# EasyEDA Pro project Board2.epro

# Schematic Schematic3
Board Name: Board2; Create Date: 2026-03-19; Page Name: P1; Project Name: WF_ADC_DEMO; Schematic Name: Schematic3; Update Date: 2026-03-24; BladeWidth: 10; Company: 嘉立创EDA; Page Size: A4; RegionStart: 1; ShowBorder: 1; TitleBlock: 1; TitleBlockPosition: 3; Version: V1.0; XRegionCount: 6; YRegionCount: 4
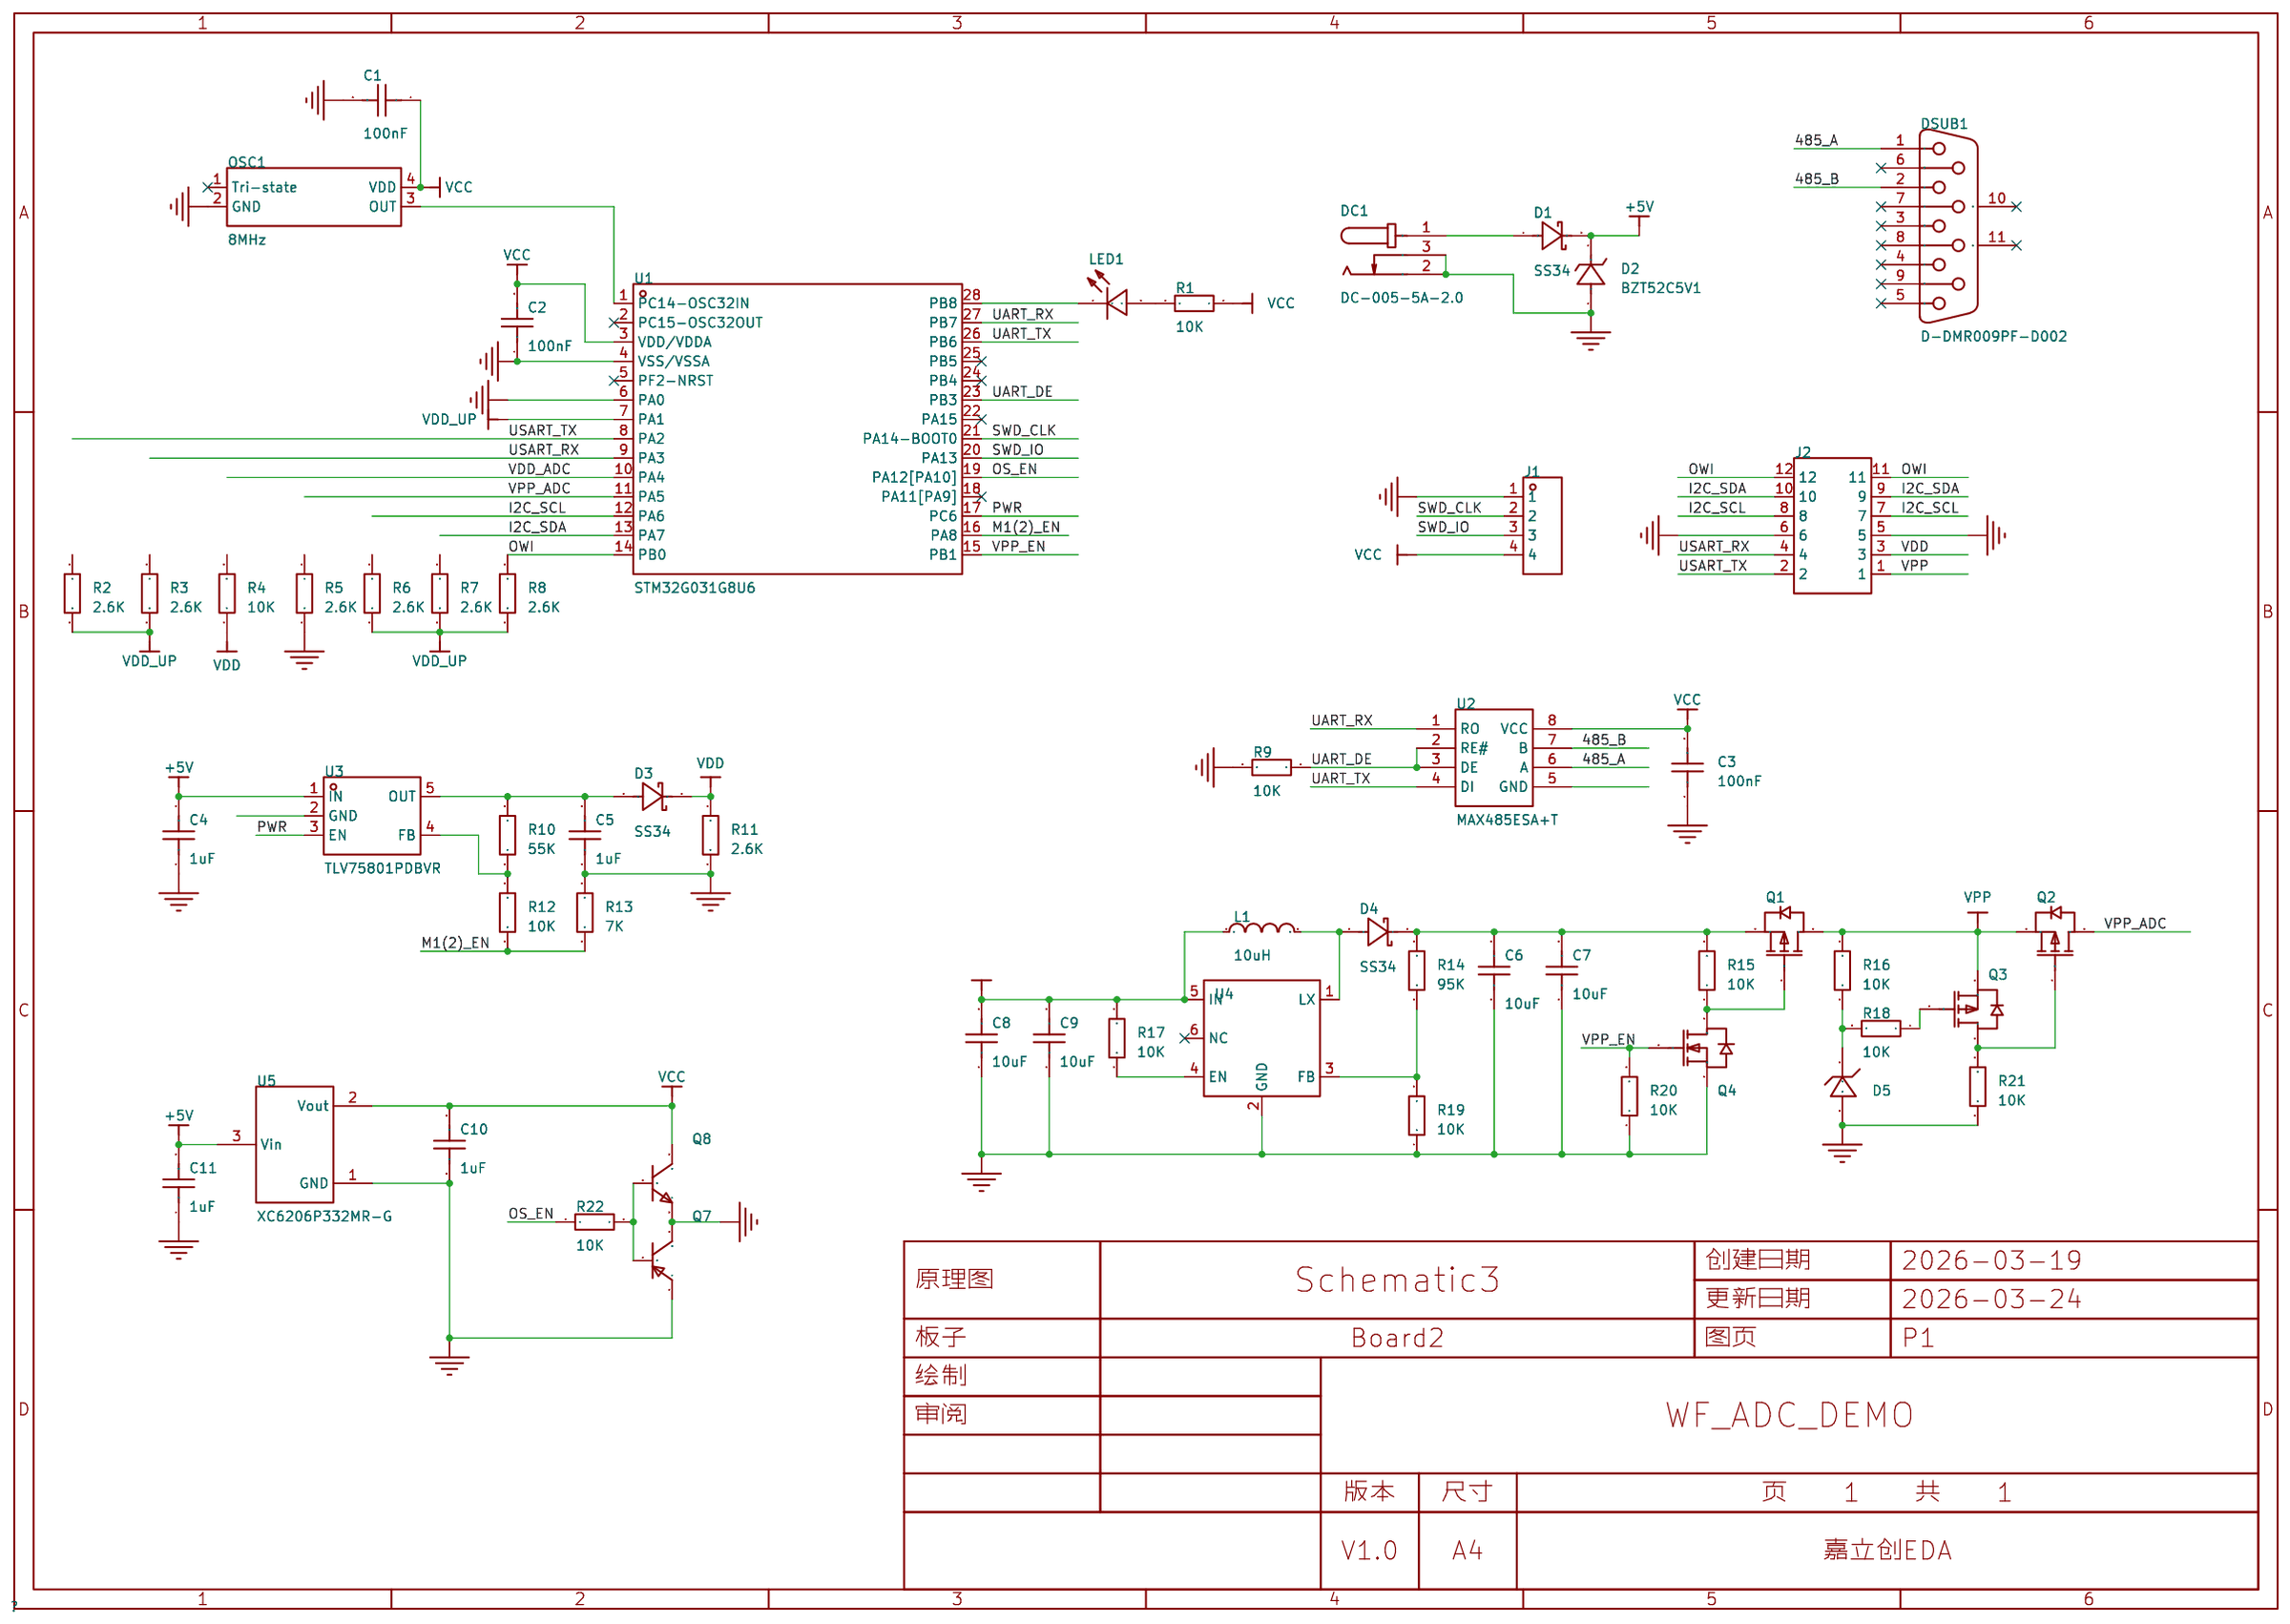
[diagram p0: schematic sheet]

## Parts
C1  100nF  [C0603]
C2  100nF  [C0603]
C3  100nF  [C0603]
C4  1uF  [C0603]
C5  1uF  [C0603]
C6  10uF  [C0805]
C7  10uF  [C0805]
C8  10uF  [C0805]
C9  10uF  [C0805]
C10  1uF  [C0603]
C11  1uF  [C0603]
D1  SS34  [SMA_L4.3-W2.6-LS5.0-FD]
D2  BZT52C5V1  [SOD-123_L2.7-W1.6-LS3.7-RD]
D3  SS34  [SMA_L4.3-W2.6-LS5.0-FD]
D4  SS34  [SMA_L4.3-W2.6-LS5.0-FD]
D5  SMBJ3.3A  [SMB_L4.6-W3.6-LS5.3-RD]
DC1  DC-005-5A-2.0  [DC-IN-TH_DC-005-5A-2.0]
DSUB1  D-DMR009PF-D002  [DSUB-TH_DMR-9S]
J1  PZ254V-11-04P  [HDR-TH_4P-P2.54-V-M]
J2  PZ254-2-06-W-8.5  [HDR-TH_12P-P2.54-H-M-R2-C6-S2.54-N]
L1  10uH  [IND-SMD_L5.4-W5.2_FXL0530]
LED1  NCD0603Y2  [LED0603-RD]
OSC1  8MHz  [OSC-SMD_4P-L3.2-W2.5-BL-1]
Q1  AO3401A  [SOT-23_L2.9-W1.3-P1.90-LS2.4-BR]
Q2  AO3401A  [SOT-23_L2.9-W1.3-P1.90-LS2.4-BR]
Q3  AO3401A  [SOT-23_L2.9-W1.3-P1.90-LS2.4-BR]
Q4  AO3400A  [SOT-23-3_L2.9-W1.3-P1.90-LS2.4-BR]
Q7  S8550  [SOT-23-3_L2.9-W1.3-P1.90-LS2.4-BR]
Q8  S8050  [SOT-23-3_L2.9-W1.3-P1.90-LS2.3-BR]
R1  10K  [R0603]
R2  2.6K  [R0603]
R3  2.6K  [R0603]
R4  10K  [R0603]
R5  2.6K  [R0603]
R6  2.6K  [R0603]
R7  2.6K  [R0603]
R8  2.6K  [R0603]
R9  10K  [R0603]
R10  55K  [R0603]
R11  2.6K  [R0603]
R12  10K  [R0603]
R13  7K  [R0603]
R14  95K  [R0603]
R15  10K  [R0603]
R16  10K  [R0603]
R17  10K  [R0603]
R18  10K  [R0603]
R19  10K  [R0603]
R20  10K  [R0603]
R21  10K  [R0603]
R22  10K  [R0603]
U1  STM32G031G8U6  [UFQFPN-28_L4.0-W4.0-P0.50-BL]
U2  MAX485ESA+T  [SOIC-8_L5.0-W4.0-P1.27-LS6.0-BL]
U3  TLV75801PDBVR  [SOT-23-5_L3.0-W1.7-P0.95-LS2.8-BR]
U4  SY7208ABC  [SOT-23-6_L2.9-W1.6-P0.95-LS2.8-BR]
U5  XC6206P332MR-G  [SOT-23-3_L2.9-W1.6-P1.90-LS2.8-BR]

## Library data of the parts
C1-C5 C10 C11 = CAP_0603: Supplier Footprint: 0603
C6-C9 = CAP_0805: Supplier Footprint: 0805
D1 D3 = SS34_C7420365: 二极管配置:独立式;正向压降(Vf):550mV@3.0A;直流反向耐压(Vr):40V;平均整流电流(Io):3A;; LCSC Part Name: 电压:40V 电流:3A; Supplier Part: C7420365; Manufacturer: 宏迦橙; Supplier Footprint: SMA(DO-214AC); JLCPCB Part Class: 扩展库; Datasheet: https://atta.szlcsc.com/upload/public/pdf/source/20230828/75438452AEE6C276EDA92B2AF599BE05.pdf; Supplier: LCSC; Diode Configuration: 独立式; Forward Voltage (Vf@If): 550mV@3.0A; Reverse Voltage (Vr): 40V; Average Rectified Current (Io): 3A; Reverse Leakage Current (Ir): 200uA@40V; Peak forward surge current: 80A
D2 = BZT52C5V1_C19077401: 二极管配置:独立式;稳压值(标称值):5.1V;稳压值(范围):4.85V~5.36V;功率(Pd):500mW;; Supplier Part: C19077401; Manufacturer: 宏迦橙; Supplier Footprint: SOD-123; JLCPCB Part Class: 扩展库; Datasheet: https://atta.szlcsc.com/upload/public/pdf/source/20241104/A31DF82E6D0CBEC29199D0B62829516E.pdf; Supplier: LCSC; Diode Configuration: 独立式; Zener Voltage (Nom): 5.1V; Reverse Leakage Current (Ir): 2uA@2V; Zener Voltage (Range): 4.85V~5.36V; Power Dissipation: 500mW; Zener Impedance (Zzt): 60Ω
D4 = SS34_C7420365: 二极管配置:独立式;正向压降(Vf):550mV@3.0A;直流反向耐压(Vr):40V;平均整流电流(Io):3A;; LCSC Part Name: 电压:40V 电流:3A; Supplier Part: C7420365; Manufacturer: 宏迦橙; Supplier Footprint: SMA(DO-214AC); JLCPCB Part Class: 扩展库; Datasheet: https://atta.szlcsc.com/upload/public/pdf/source/20230828/75438452AEE6C276EDA92B2AF599BE05.pdf; Supplier: LCSC; Diode Configuration: 独立式; Forward Voltage (Vf@If): 550mV@3.0A; Reverse Voltage (Vr): 40V; Average Rectified Current (Io): 3A; Reverse Leakage Current (Ir): 200uA@40V; Peak forward surge current: 80A; Voltage - Forward(Vf@If): 550mV@3.0A; Voltage - DC Reverse(Vr): 40V; Current - Rectified: 3A
D5 = SMBJ3.3A_C19077556: 极性:单向;反向截止电压(Vrwm):3.3V;钳位电压:8V;峰值脉冲电流(Ipp):75A@10/1000us;峰值脉冲功率(Ppp):600W@10/1000us;击穿电压:6.5V;; LCSC Part Name: 单向TVS 3.3V截止 峰值浪涌电流：75A@10/1000us; Supplier Part: C19077556; Manufacturer: R+O(宏嘉诚); Supplier Footprint: DO-214AA(SMB); JLCPCB Part Class: 扩展库; Datasheet: https://item.szlcsc.com/datasheet/SMBJ3.3A/20275641.html; Supplier: LCSC; Polarity: 单向; Reverse Stand-Off Voltage (Vrwm): 3.3V; Clamping Voltage: 8V; Peak Pulse Current (Ipp): 75A@10/1000us; Peak Pulse Power Dissipation (Ppp): 600W@10/1000us; Voltage - Breakdown: 6.5V; Reverse Leakage Current (Ir): 600uA; Operating Temperature: -55℃~+150℃; level of protection: IEC 61000-4-2; Type: TVS
DC1 = DC-005-5A-2.0: 连接器类型:DC电源插座;安装方式:弯插;触点内径:2mm;触点外径:6.2mm;额定电流:5A;额定电压:24V;工作温度范围:-20℃~+70℃;; LCSC Part Name: DC电源插座 内径:2mm 外径:6.2mm; Supplier Part: C381116; Manufacturer: XKB Connection(中国星坤); Supplier Footprint: 插件; JLCPCB Part Class: 扩展库; Datasheet: https://atta.szlcsc.com/upload/public/pdf/source/20211015/707A35F7AB6E89C57AAB641950105BB7.pdf; Supplier: LCSC; Connector Type: DC电源插座; Mounting Style: 弯插; Inside Contact Diameter: 2mm; Outside Contact Diameter: 6.2mm; Current Rating (Max): 5A; Voltage Rating (Max): 24V; Operating Temperature Range: -20℃~+70℃
DSUB1 = D-DMR009PF-D002: 连接器类型:常规D-Sub;公母:母;总PIN位数:9P;安装方式:弯插;排数:2;额定电流-信号脚:3A;工作温度范围:-50℃~+105℃;; LCSC Part Name: D-Sub 母 P数:9P; Supplier Part: C141882; Manufacturer: Ckmtw(灿科盟); Supplier Footprint: 弯插; JLCPCB Part Class: 扩展库; Datasheet: https://atta.szlcsc.com/upload/public/pdf/source/20171123/C141882_15114109686951137625.pdf; Supplier: LCSC; Connector Type: 常规D-Sub; Gender: 母; Number of Pins: 9P; Mounting Style: 弯插; Number of Rows: 2; Current Rating-Signal (Max): 3A; Colour: 黑色; Operating Temperature Range: -50℃~+105℃
J1 = PZ254V-11-04P: 插针结构:1x4P;间距:2.54mm;行距:-;圆针/方针:方针;安装类型:直插;排数:单排;总PIN位数:4P;额定电流:3A;额定电压:250V;配合针长度:6mm;塑高:2.5mm;端接针长度:3mm;触头材质:-;工作温度范围:-40℃~+105℃;颜色:黑色;; LCSC Part Name: 间距:2.54mm 1x4P 直插 方针; Supplier Part: C2691448; Manufacturer: XFCN(兴飞); Supplier Footprint: 插件,P=2.54mm; JLCPCB Part Class: 扩展库; Datasheet: https://atta.szlcsc.com/upload/public/pdf/source/20200309/C492403_F9F19131791D08044AD4F84F8E751A34.pdf; Supplier: LCSC; Pin Structure: 1x4P; Pitch: 2.54mm; Circluar Pins/Square Pins: 方针; Mounting Type: 直插; Number of Rows: 单排; Number of Pins: 4P; Current Rating (Max): 3A; Voltage Rating (Max): 250V; Length of Mating Pin: 6mm; Insulation Height: 2.5mm; Length of End Connection Pin: 3mm; Operating Temperature Range: -40℃~+105℃; Color: 黑色
J2 = PZ254-2-06-W-8.5: 插针结构:2x6P;间距:2.54mm;行距:2.54mm;圆针/方针:方针;安装方式:弯插;排数:双排;总PIN位数:12P;额定电流:3A;额定电压:-;配合针长度:6mm;塑高:2.5mm;端接针长度:-;触头材质:-;工作温度:-40℃~+105℃;颜色:黑色;; LCSC Part Name: 2x6P 间距:2.54mm 方针 弯插; Supplier Part: C2894986; Manufacturer: HCTL(华灿天禄); Supplier Footprint: 弯插,P=2.54mm; JLCPCB Part Class: 扩展库; Datasheet: https://item.szlcsc.com/datasheet/PZ254-2-06-W-8.5/3132662.html; Supplier: LCSC; Pin Structure: 2x6P; Pitch: 2.54mm; Row Spacing: 2.54mm; Circluar Pins/Square Pins: 方针; Mounting Type: 弯插; Number of Rows: 双排; Number of Pins: 12P; Current Rating: 3A; Length of Mating Pin: 6mm; Insulation Height: 2.5mm; Operating Temperature: -40℃~+105℃; Color: 黑色
L1 = FXL0530-100-M: 电感值:10uH;精度:±20%;额定电流:3.2A;饱和电流(Isat):3.5A;类型:一体成型电感;; LCSC Part Name: 10uH ±20% 3.5A; Supplier Part: C177248; Manufacturer: cjiang(长江微电); Supplier Footprint: SMD,5.4x5.2mm; JLCPCB Part Class: 扩展库; Datasheet: https://item.szlcsc.com/datasheet/FXL0530-100-M/188640.html; Supplier: LCSC; Tolerance: ±20%; Current Rating: 3.2A; Current - Saturation(Isat): 3.5A; DC Resistance(DCR): 125mΩ; Type: 一体成型电感
LED1 = NCD0603Y2: 灯头类型:-;发光颜色:黄色;正向压降(Vf):1.6V~2.6V;功率:65mW;正向电流:25mA;波长:586nm~595nm;二极管配置:独立二极管;透镜颜色:-;色温:-;发光强度:220mcd;发光角度:130°;载带方式:-;工作温度:-30℃~+85℃;; LCSC Part Name: 片式发光二极管; Supplier Part: C89811; Manufacturer: 国星光电; Supplier Footprint: 0603; JLCPCB Part Class: 扩展库; Datasheet: https://item.szlcsc.com/datasheet/NCD0603Y2/90993.html; Supplier: LCSC; Illumination Color: 黄色; Voltage - Forward(Vf): 1.6V~2.6V; Power(Watts): 65mW; Forward Current: 25mA; Wavelength - Dominant: 586nm~595nm; Peak Wavelength: 595nm; Diode Configuration: 独立二极管; Luminous Intensity: 220mcd; Viewing Angle: 130°; Operating Temperature: -30℃~+85℃
OSC1 = OT2EL4C4JI-111OLP-8M: 频率:8MHz;常温频差:±10ppm;输出模式:CMOS;工作电压:1.8V~3.3V;频率稳定度:±20ppm;; LCSC Part Name: 8MHZ?1.8V-3.3V?±10PPM YSO110TR; Supplier Part: C5189450; Manufacturer: YXC(扬兴晶振); Supplier Footprint: SMD3225-4P; JLCPCB Part Class: 扩展库; Datasheet: https://atta.szlcsc.com/upload/public/pdf/source/20240731/596E5F7673E50DA744B7F79F139FB8DF.pdf; Supplier: LCSC; Normal temperature Frequency Tolerance: ±10ppm; Output Type: CMOS; Voltage - Supply: 1.8V~3.3V; Frequency Stability: ±20ppm; Operating Temperature: -40℃~+85℃
Q1-Q3 = AO3401A_C15127: 数量:1个P沟道;漏源电压(Vdss):30V;连续漏极电流(Id):4A;导通电阻(RDS(on)):47mΩ@10V；85mΩ@2.5V；60mΩ@4.5V;耗散功率(Pd):-;阈值电压(Vgs(th)):900mV@250uA;; LCSC Part Name: 1个P沟道 耐压:30V 电流:4A; Supplier Part: C15127; Manufacturer: AOS; Supplier Footprint: SOT-23; JLCPCB Part Class: 基础库; Datasheet: https://item.szlcsc.com/datasheet/AO3401A/15801.html; Supplier: LCSC; Number: 1个P沟道; Drain to Source Voltage: 30V; Current - Continuous Drain(Id): 4A; RDS(on): 47mΩ@10V；85mΩ@2.5V；60mΩ@4.5V; Gate Threshold Voltage (Vgs(th)): 900mV@250uA; Gate Charge(Qg): 14nC@10V; Input Capacitance(Ciss): 645pF; Reverse Transfer Capacitance (Crss@Vds): 55pF; Output Capacitance(Coss): 80pF
Q4 = AO3400A_C20917: 数量:-;漏源电压(Vdss):30V;连续漏极电流(Id):-;导通电阻(RDS(on)):48mΩ@2.5V;耗散功率(Pd):-;阈值电压(Vgs(th)):1.45V@250uA;; LCSC Part Name: 1个N沟道 耐压:30V 电流:5.7A; Supplier Part: C20917; Manufacturer: AOS; Supplier Footprint: SOT-23-3L; JLCPCB Part Class: 基础库; Datasheet: https://item.szlcsc.com/datasheet/AO3400A/21629.html; Supplier: LCSC; Drain to Source Voltage: 30V; RDS(on): 48mΩ@2.5V; Gate Threshold Voltage (Vgs(th)): 1.45V@250uA; Gate Charge(Qg): 7nC@10V; Input Capacitance(Ciss): 630pF@15V; Operating Temperature: -55℃~+150℃@(Tj); Type: N沟道
Q7 = S8550_C20069126: 晶体管类型:PNP;集电极电流(Ic):500mA;集射极击穿电压(Vceo):25V;耗散功率(Pd):300mW;直流电流增益(hFE):120@500mA,1.0V;; LCSC Part Name: hFE:200-350，丝印:2TY PNP 电流:500mA 电压:25V; Supplier Part: C20069126; Manufacturer: R+O(宏嘉诚); Supplier Footprint: SOT-23; JLCPCB Part Class: 扩展库; Datasheet: https://item.szlcsc.com/datasheet/S8550/21397164.html; Supplier: LCSC; type: PNP; Current - Collector(Ic): 500mA; Collector - Emitter Voltage VCEO: 25V; Pd - Power Dissipation: 300mW; DC Current Gain: 120@500mA,1.0V; Transition frequency(fT): 150MHz; Current - Collector Cutoff: 100nA; Vce Saturation(VCE(sat)): 500mV; Operating Temperature: -55℃~+150℃; Emitter-Base Voltage(Vebo): 5V
Q8 = S8050_C20069125: 晶体管类型:NPN;集电极电流(Ic):500mA;集射极击穿电压(Vceo):25V;耗散功率(Pd):300mW;直流电流增益(hFE):120@50mA,1.0V;; LCSC Part Name: hFE:200-350，丝印:J3Y NPN 500mA 25V; Supplier Part: C20069125; Manufacturer: R+O(宏嘉诚); Supplier Footprint: SOT-23; JLCPCB Part Class: 扩展库; Datasheet: https://item.szlcsc.com/datasheet/S8050/21397163.html; Supplier: LCSC; type: NPN; Current - Collector(Ic): 500mA; Collector - Emitter Voltage VCEO: 25V; Pd - Power Dissipation: 300mW; DC Current Gain: 120@50mA,1.0V; Transition frequency(fT): 100MHz; Current - Collector Cutoff: 100nA; Vce Saturation(VCE(sat)): 600mV@500mA,50mA; Operating Temperature: -55℃~+150℃; Emitter-Base Voltage(Vebo): 5V
R1-R22 = Res_0603: Supplier Footprint: 0603
U1 = STM32G031G8U6: CPU内核:ARM-M系列;CPU最大主频:64MHz;应用领域:-;; LCSC Part Name: 主流Arm Cortex-M0+ MCU，具有64 KB Flash存储器、8 KB RAM、64 MHz CPU、2x USART、定时器、ADC和通信接口，1.7-3.6V; Supplier Part: C432211; Manufacturer: ST(意法半导体); Supplier Footprint: UFQFPN-28(4x4); JLCPCB Part Class: 扩展库; Datasheet: https://atta.szlcsc.com/upload/public/pdf/source/20190927/C432211_623EEFA1D407096BEEBF7364175DF17E.pdf; Supplier: LCSC; CPU Core: ARM-M系列; CPU Maximum Speed: 64MHz; Program Storage Size: 64KB; Program Memory Type: FLASH; Number of I/O: 26; ADC (Bit): 12bit; Low Voltage Detection Threshold: 1.7V~3.6V
U2 = MAX485ESA+T: 类型:收发器;数据速率:2.5Mbps;; LCSC Part Name: 低功耗，限斜率RS-485/RS-422收发器; Supplier Part: C19738; Manufacturer: ADI(亚德诺)/MAXIM(美信); Supplier Footprint: SOIC-8; JLCPCB Part Class: 扩展库; Datasheet: https://atta.szlcsc.com/upload/public/pdf/source/20140614/1457707090366.pdf; Supplier: LCSC; Types: 收发器; Number of Driver: 1; Number of receiver: 1; Supply Voltage: 4.75V~5.25V; Data Rate: 2.5Mbps; Operating Temperature: -40℃~+85℃
U3 = TLV75801PDBVR: 输出类型:可调;最大输入电压:6V;输出电压:550mV~5.5V;输出电流:500mA;输出极性:正极;; LCSC Part Name: 具有使能功能的 500mA、低 IQ、高精度、可调节超低压降稳压器; Supplier Part: C2877852; Manufacturer: TI(德州仪器); Supplier Footprint: SOT-23-5; JLCPCB Part Class: 扩展库; Datasheet: https://www.ti.com/cn/lit/gpn/tlv758p; Supplier: LCSC; Output Type: 可调; Maximum Input Voltage: 6V; Output Voltage: 550mV~5.5V; Output Current: 500mA; Dropout Voltage: 720mV@(500mA); standby current: 35uA; Feature: 防静电保护；软启动；短路保护；自动放电功能；低ESR；热保护(TSD)；欠压闭锁；过流保护(OCP)；带使能；防倒灌; Operating Temperature: -40℃~+125℃@(Tj); Output Polarity: 正极; Number of Outputs: 1
U4 = SY7208ABC: 功能类型:升压型;工作电压:3V~25V;输出电压:600mV~25V;输出电流:2A;输出类型:可调;; LCSC Part Name: 高效率1MHz 2A升压转换器; Supplier Part: C80514; Manufacturer: Silergy(矽力杰); Supplier Footprint: SOT-23-6; JLCPCB Part Class: 扩展库; Datasheet: https://item.szlcsc.com/datasheet/SY7208ABC/81660.html; Supplier: LCSC; Function: 升压型; Voltage - Supply: 3V~25V; Output Voltage: 600mV~25V; Output Current: 2A; Frequency - Switching: 800kHz~1.2MHz; Operating Temperature: -40℃~+125℃@(TJ); Synchronous Rectifier: 否; Number of Outputs: 1; Topology: 升压式; Quiescent Current: 100uA; Switch tube (built-in/external): 内置; Output Type: 可调
U5 = XC6206P332MR-G_C5446: 输出类型:固定;最大输入电压:6V;输出电压:3.3V;最大输出电流:200mA;电源纹波抑制比(PSRR):-;输出极性:正极;; LCSC Part Name: 输入6V 输出3.3V 200mA; Supplier Part: C5446; Manufacturer: TOREX(特瑞仕); Supplier Footprint: SOT-23-3L; JLCPCB Part Class: 基础库; Datasheet: https://atta.szlcsc.com/upload/public/pdf/source/20130823/1457706639850.pdf; Supplier: LCSC; Output Type: 固定; Maximum Input Voltage: 6V; Output Voltage: 3.3V; MAX Output Current: 200mA; Dropout Voltage: 680mV@(100mA); Output Polarity: 正极; Number of Outputs: 1

## Nets
+5V: C4.2 C8.2 C9.2 C11.2 D1.2(K) D2.1(K) L1.1 R17.2 U3.1(IN) U4.5(IN) U5.3(Vin)
GND: C1.2 C2.1 C3.1 C4.1 C5.1 C6.1 C7.1 C8.1 C9.1 C10.1 C11.1 D2.2(A) D5.2 DC1.2 DC1.3 J1.1 OSC1.2(GND) Q4.2(S) Q7.2(E) R5.2 R9.2 R11.2 R13.2 R19.1 R20.1 R21.1 U1.4(VSS/VSSA) U2.5(GND) U3.2(GND) U4.2(GND) U5.1(GND)
PGND: J2.5 J2.6 Q7.3(C) Q8.2(E) U1.6(PA0)
VCC: C1.1 C2.2 C3.2 C10.2 J1.4 OSC1.4(VDD) Q8.3(C) R1.1 U1.3(VDD/VDDA) U2.8(VCC) U5.2(Vout)
VDD: D3.2(K) J2.3 R4.1 R11.1
VDD_ADC: R4.2 U1.10(PA4)
VDD_UP: R2.2 R3.2 R6.2 R7.2 R8.2 U1.7(PA1)
485_A: DSUB1.1 U2.6(A)
485_B: DSUB1.2 U2.7(B)
I2C_SCL: J2.7 J2.8 R6.1 U1.12(PA6)
I2C_SDA: J2.9 J2.10 R7.1 U1.13(PA7)
M1(2)_EN: R12.1 R13.1 U1.16(PA8)
OS_EN: R22.1 U1.19(PA12[PA10])
OWI: J2.11 J2.12 R8.1 U1.14(PB0)
PWR: U1.17(PC6) U3.3(EN)
SWD_CLK: J1.2 U1.21(PA14-BOOT0)
SWD_IO: J1.3 U1.20(PA13)
UART_DE: R9.1 U1.23(PB3) U2.2(RE#) U2.3(DE)
UART_RX: U1.27(PB7) U2.1(RO)
UART_TX: U1.26(PB6) U2.4(DI)
USART_RX: J2.4 R3.1 U1.9(PA3)
USART_TX: J2.2 R2.1 U1.8(PA2)
VPP: J2.1 Q1.3(D) Q2.2(S) Q3.2(S) R16.2
VPP_ADC: Q2.3(D) R5.1 U1.11(PA5)
VPP_EN: Q4.1(G) R20.2 U1.15(PB1)
$1N1691: R10.1 R12.2 U3.4(FB)
$1N1692: C5.2 D3.1(A) R10.2 U3.5(OUT)
$1N3646: R17.1 U4.4(EN)
$1N3648: R14.1 R19.2 U4.3(FB)
$1N3649: D4.1(A) L1.2 U4.1(LX)
$1N3650: C6.2 C7.2 D4.2(K) Q1.2(S) R14.2 R15.2
$1N6475: Q7.1(B) Q8.1(B) R22.2
$1N6524: Q1.1(G) Q4.3(D) R15.1
$1N8025: D1.1(A) DC1.1
$1N8260: OSC1.3(OUT) U1.1(PC14-OSC32IN)
$1N9279: Q2.1(G) Q3.3(D) R21.2
$1N9281: D5.1 R16.1 R18.2
$1N9282: Q3.1(G) R18.1
$1N12699: LED1.1(K) U1.28(PB8)
$1N12700: LED1.2(A) R1.2

Not connected (* = marked no-connect by the designer): DSUB1 3* 4* 5* 6* 7* 8* 9* 10(MH1)* 11(MH2)*; OSC1 1(Tri-state)*; U1 2(PC15-OSC32OUT)* 5(PF2-NRST)* 18(PA11[PA9])* 22(PA15)* 24(PB4)* 25(PB5)*; U4 6(NC)*

# Board 16005 WF280_OS_V1_20260323
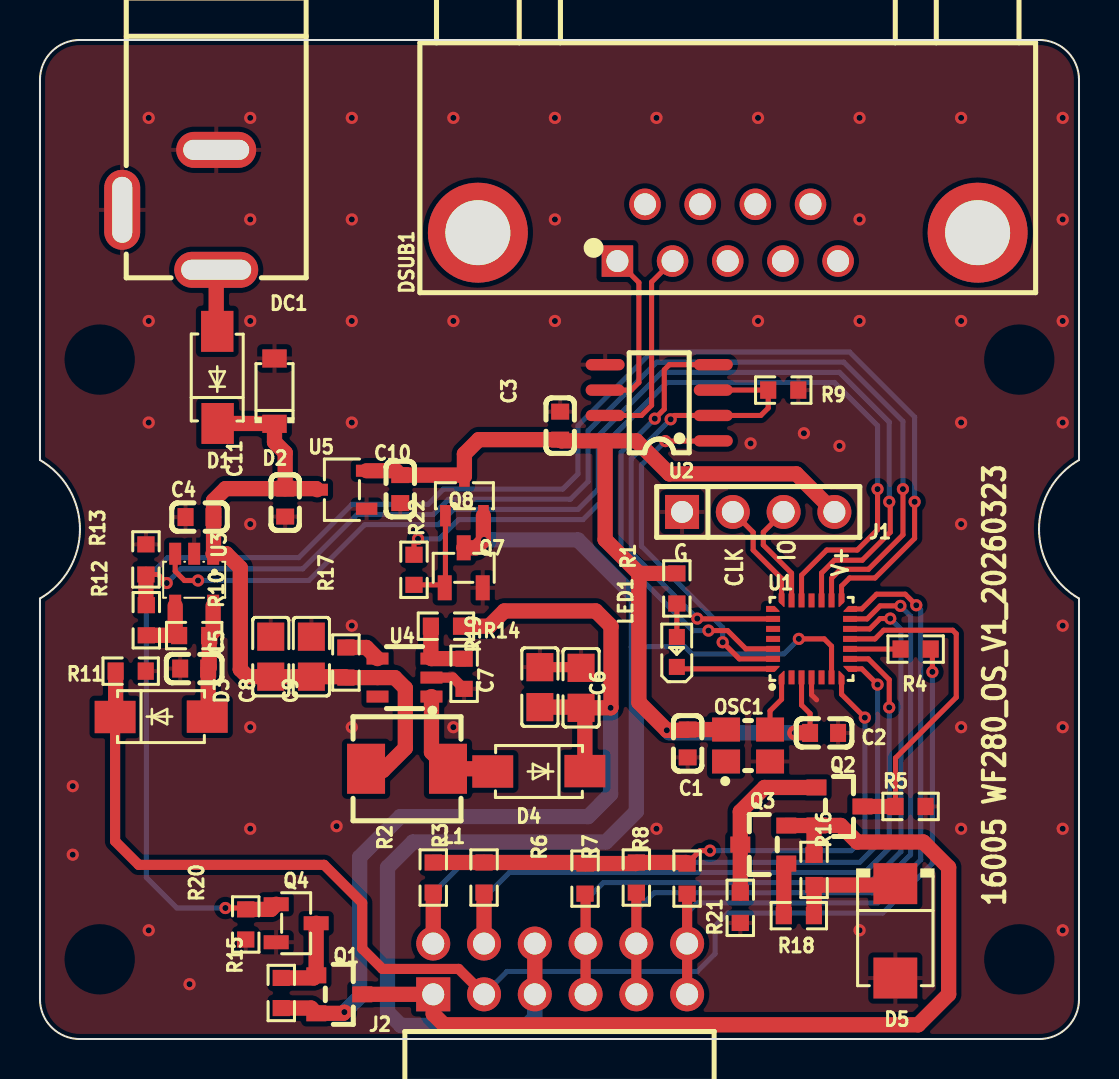
[diagram p1: board, top side]
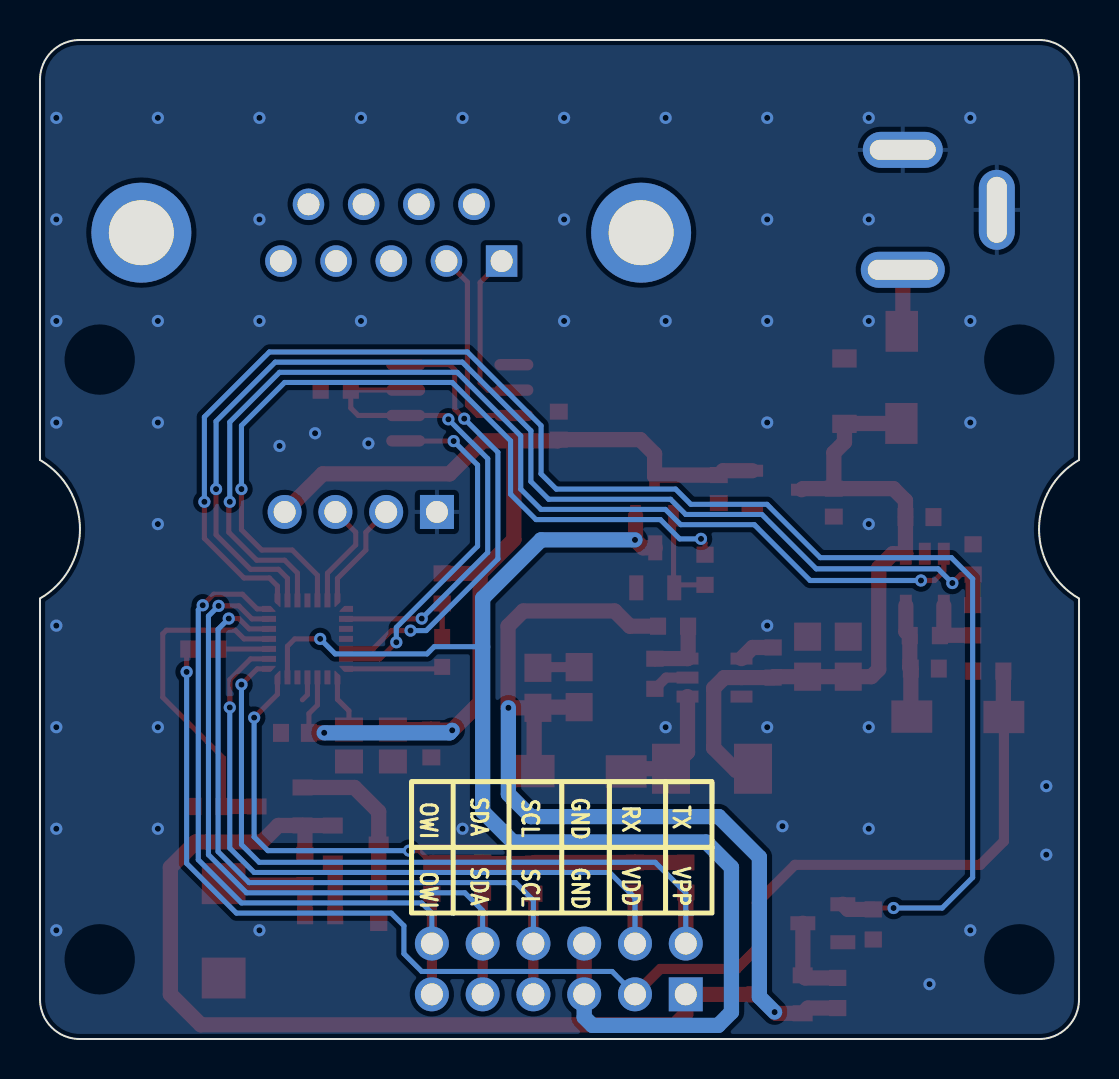
[diagram p2: board, bottom side, seen from below]

Outline 51.98 x 49.98 mm; copper layers: Top Layer, Bottom Layer. Coordinates in mm from the lower left corner of the outline.
Outline path: 0,47.99 arc(0.58,49.39) 1.99,49.98 49.99,49.98 arc(51.39,49.39) 51.98,47.99 51.98,28.96 arc(49.98,25.5) 51.98,22.04 51.98,1.99 arc(51.39,0.58) 49.99,0 1.99,0 arc(0.58,0.58) 0,1.99 0,22.04 arc(2,25.5) 0,28.96 0,47.99
Stack: Top Layer 0.035mm / Dielectric1 1.51mm FR4 er 4.5 / Bottom Layer 0.035mm

## Design rules (mm)
spacing copperThickness1oz (default): track to track 0.102, other pairs 0.152 to 0.3
spacing copperThickness2oz: track to track 0.203, other pairs 0.152 to 0.3
spacing Plane_innerPlane: track to track 0.102, other pairs 0.152 to 0.3
spacing Copper_copperRegion: track to track 0.102, other pairs 0.152 to 0.3
track width copperThickness1oz (default): min 0.127, default 0.254, max 2.54
track width copperThickness2oz: min 0.203, default 0.254, max 2.54
differential pair differentialPair (default): width min 0.127, default 0.254, max 2.54; gap min 0.152, default 0.152
pour e1324 uses Copper_copperRegion
pour e1338 uses Copper_copperRegion

## Placement (name value [footprint] x y rotation side)
C1  100nF  [C0603]  32.4 14.79 270 top
C2  100nF  [C0603]  39.22 15.31 180 top
C3  100nF  [C0603]  26.02 30.68 270 top
C4  1uF  [C0603]  7.98 26.11 0 top
C5  1uF  [C0603]  7.71 18.53 0 top
C6  10uF  [C0805]  27.07 17.57 270 top
C7  10uF  [C0805]  25.01 17.6 270 top
C8  10uF  [C0805]  11.54 19.13 270 top
C9  10uF  [C0805]  13.58 19.13 270 top
C10  1uF  [C0603]  18.02 27.51 90 top
C11  1uF  [C0603]  12.27 26.83 90 top
D1  SS34  [SMA_L4.3-W2.6-LS5.0-FD]  8.88 33.1 270 top
D2  BZT52C5V1  [SOD-123_L2.7-W1.6-LS3.7-RD]  11.73 32.41 90 top
D3  SS34  [SMA_L4.3-W2.6-LS5.0-FD]  6.06 16.12 180 top
D4  SS34  [SMA_L4.3-W2.6-LS5.0-FD]  24.95 13.39 0 top
D5  SMBJ3.3A  [SMB_L4.6-W3.6-LS5.3-RD]  42.79 5.41 270 top
DC1  DC-005-5A-2.0  [DC-IN-TH_DC-005-5A-2.0]  6.46 41.48 270 top
DSUB1  D-DMR009PF-D002  [DSUB-TH_DMR-9S]  34.4 40.34 90 top
J1  PZ254V-11-04P  [HDR-TH_4P-P2.54-V-M]  35.93 26.37 0 top
J2  PZ254-2-06-W-8.5  [HDR-TH_12P-P2.54-H-M-R2-C6-S2.54-N]  26.02 3.51 0 top
L1  10uH  [IND-SMD_L5.4-W5.2_FXL0530]  18.36 13.52 0 top
LED1  NCD0603Y2  [LED0603-RD]  31.86 19.36 90 top
OSC1  8MHz  [OSC-SMD_4P-L3.2-W2.5-BL-1]  35.42 14.68 0 top
Q1  AO3401A  [SOT-23_L2.9-W1.3-P1.90-LS2.4-BR]  14.97 2.24 180 top
Q2  AO3401A  [SOT-23_L2.9-W1.3-P1.90-LS2.4-BR]  39.99 11.63 180 top
Q3  AO3401A  [SOT-23_L2.9-W1.3-P1.90-LS2.4-BR]  36.18 9.73 0 top
Q4  AO3400A  [SOT-23-3_L2.9-W1.3-P1.90-LS2.4-BR]  12.81 5.79 180 top
Q7  S8550  [SOT-23-3_L2.9-W1.3-P1.90-LS2.4-BR]  21.2 23.57 270 top
Q8  S8050  [SOT-23-3_L2.9-W1.3-P1.90-LS2.3-BR]  21.23 27.17 270 top
R1  10K  [R0603]  31.86 22.54 270 top
R2  2.6K  [R0603]  19.67 8.08 90 top
R3  2.6K  [R0603]  22.21 8.08 90 top
R4  10K  [R0603]  43.8 19.51 180 top
R5  2.6K  [R0603]  43.55 11.63 0 top
R6  2.6K  [R0603]  27.26 8.02 90 top
R7  2.6K  [R0603]  29.83 8.08 90 top
R8  2.6K  [R0603]  32.37 8.02 90 top
R9  10K  [R0603]  37.18 32.46 0 top
R10  55K  [R0603]  7.71 20.18 0 top
R11  2.6K  [R0603]  4.54 18.4 0 top
R12  10K  [R0603]  5.32 20.95 270 top
R13  7K  [R0603]  5.3 23.99 90 top
R14  95K  [R0603]  20.31 20.65 0 top
R15  10K  [R0603]  12.07 2.3 270 top
R16  10K  [R0603]  38.72 8.46 90 top
R17  10K  [R0603]  15.3 18.83 270 top
R18  10K  [R0603]  37.96 6.17 0 top
R19  10K  [R0603]  21.22 18.27 90 top
R20  10K  [R0603]  10.29 5.73 90 top
R21  10K  [R0603]  35.03 6.56 90 top
R22  10K  [R0603]  18.71 23.47 270 top
U1  STM32G031G8U6  [UFQFPN-28_L4.0-W4.0-P0.50-BL]  38.6 20.02 0 top
U2  MAX485ESA+T  [SOIC-8_L5.0-W4.0-P1.27-LS6.0-BL]  30.98 31.83 90 top
U3  TLV75801PDBVR  [SOT-23-5_L3.0-W1.7-P0.95-LS2.8-BR]  7.71 22.98 90 top
U4  SY7208ABC  [SOT-23-6_L2.9-W1.6-P0.95-LS2.8-BR]  18.23 18.08 0 top
U5  XC6206P332MR-G  [SOT-23-3_L2.9-W1.6-P1.90-LS2.8-BR]  15.11 27.48 0 top

## Footprints (pads in the part's own frame, mm; a bottom-side part is the same pattern mirrored in y, then rotated)
C0603
  rect 0.8x0.9 smd: 1(-0.7,0) 2(0.7,0)
C0805
  rect 1.41x1.35 smd: 1(-1,0) 2(1,0)
DC-IN-TH_DC-005-5A-2.0
  oval 1.8x4.2 hole 1x3.5: 1(3,2.352)
  oval 1.8x4 hole 1x3.3: 2(-3,2.352)
  oval 4x1.8 hole 3.3x1: 3(-0.001,-2.352)
DSUB-TH_DMR-9S
  rect 1.575x1.575 hole 1.1: 1(-1.42,5.52)
  round 1.575 hole 1.1: 2(-1.42,2.76) 3(-1.42,0) 4(-1.42,-2.76) 5(-1.42,-5.52) 6(1.42,4.14) 7(1.42,1.38) 8(1.42,-1.38) 9(1.42,-4.14)
  round 5 hole 3.25: 10(0,12.5) 11(0,-12.5)
HDR-TH_4P-P2.54-V-M
  rect 1.7x1.7 hole 1.1: 1(-3.81,0)
  round 1.7 hole 1.1: 2(-1.27,0) 3(1.27,0) 4(3.81,0)
HDR-TH_12P-P2.54-H-M-R2-C6-S2.54-N
  rect 1.7x1.7 hole 1.1: 1(-6.35,-1.27)
  round 1.7 hole 1.1: 2(-6.35,1.27) 3(-3.81,-1.27) 4(-3.81,1.27) 5(-1.27,-1.27) 6(-1.27,1.27) 7(1.27,-1.27) 8(1.27,1.27) 9(3.81,-1.27) 10(3.81,1.27) 11(6.35,-1.27) 12(6.35,1.27)
IND-SMD_L5.4-W5.2_FXL0530
  rect 1.9x2.5 smd: 1(-2.05,0) 2(2.05,0)
LED0603-RD
  rect 0.8x0.8 smd: 1(-0.749,0) 2(0.749,0)
OSC-SMD_4P-L3.2-W2.5-BL-1
  rect 1.4x1.2 smd: 1(-1.1,-0.8) 2(1.1,-0.8) 3(1.1,0.8) 4(-1.1,0.8)
R0603
  rect 0.806x0.864 smd: 1(-0.753,0) 2(0.753,0)
SMA_L4.3-W2.6-LS5.0-FD
  rect 2.046x1.62 smd: 1(-2.304,-0.009) 2(2.304,0.009)
SMB_L4.6-W3.6-LS5.3-RD
  rect 2.047x2.192 smd: 1(-2.361,0) 2(2.361,0)
SOD-123_L2.7-W1.6-LS3.7-RD
  rect 0.91x1.22 smd: 1(-1.635,0) 2(1.635,0)
SOIC-8_L5.0-W4.0-P1.27-LS6.0-BL
  oval 0.569x1.95 smd: 1(-1.905,-2.705) 2(-0.635,-2.705) 3(0.635,-2.705) 4(1.905,-2.705) 5(1.905,2.705) 6(0.635,2.705) 7(-0.635,2.705) 8(-1.905,2.705)
SOT-23-3_L2.9-W1.3-P1.90-LS2.3-BR
  rect 1.07x0.532 smd: 1(0.99,-0.95) 2(0.99,0.95) 3(-0.99,0)
SOT-23-3_L2.9-W1.3-P1.90-LS2.4-BR
  rect 1.25x0.7 smd: 1(1,-0.95) 2(1,0.95) 3(-1,0)
SOT-23-3_L2.9-W1.6-P1.90-LS2.8-BR
  rect 1.07x0.6 smd: 1(1.235,-0.95) 2(1.235,0.95) 3(-1.235,0)
SOT-23-5_L3.0-W1.7-P0.95-LS2.8-BR
  rect 1.1x0.6 smd: 1(1.3,-0.95) 2(1.3,0) 3(1.3,0.95) 4(-1.3,0.95) 5(-1.3,-0.95)
SOT-23-6_L2.9-W1.6-P0.95-LS2.8-BR
  rect 1.1x0.6 smd: 1(1.35,-0.95) 2(1.35,0) 3(1.35,0.95) 4(-1.35,0.95) 5(-1.35,0) 6(-1.35,-0.95)
SOT-23_L2.9-W1.3-P1.90-LS2.4-BR
  rect 1x0.8 smd: 1(1.15,-0.95) 2(1.15,0.95) 3(-1.15,0)
UFQFPN-28_L4.0-W4.0-P0.50-BL
  custom 0.3x0.675 smd: 1(-1.5,-1.875) 7(1.5,-1.875) 15(1.5,1.875) 21(-1.5,1.875)
  rect 0.3x0.7 smd: 2(-1,-1.925) 3(-0.5,-1.925) 4(0,-1.925) 5(0.5,-1.925) 6(1,-1.925) 16(1,1.925) 17(0.5,1.925) 18(0,1.925) 19(-0.5,1.925) 20(-1,1.925)
  custom 0.675x0.3 smd: 8(1.875,-1.5) 14(1.875,1.5) 22(-1.875,1.5) 28(-1.875,-1.5)
  rect 0.7x0.3 smd: 9(1.925,-1) 10(1.925,-0.5) 11(1.925,0) 12(1.925,0.5) 13(1.925,1) 24(-1.925,0.5) 25(-1.925,0) 26(-1.925,-0.5) 27(-1.925,-1)
  custom 0.7x0.3 smd: 23(-1.925,1)

## Nets
As in the schematic.

Pads without a net: DSUB1 3 4 5 6 7 8 9 10 11; OSC1 1; U1 2 5 18 22 24 25; U4 6

## Via types
v1: diameter 0.61, hole 0.305, Top Layer to Bottom Layer, 79 vias

## Routing (per net, layer and track width the routed paths; a pad name or vN(x,y) marks a point on that pad's centre or on a via; arc(x,y) is an arc through that point)
+5V: length 35.2
  Top Layer w0.762: U5.3 13.81,27.53 C11.2 ; C11.2 9.28,27.53 8.68,26.93 C4.2 8.68,24.29 U3.1 9.32,24.28 10.02,23.57 10.02,18.49 10.39,18.13 C8.2 C9.2 15.26,18.13 R17.2 U4.5 17.75,18.08 18.28,17.55 18.28,14.55 17.16,13.44 16.39,13.44 ; C11.2 12.27,29.33 11.73,29.86 11.73,30.77 11.71,30.79 D1.2
GND: length 5.2
  Top Layer w0.254: 38.85,16.97 38.6,17.22 U1.4
  Top Layer w0.508: C6.1 27.03,18.6 C7.1 ; U4.2 20.65,18.08 21.22,17.52
  vias: v1(1.64,12.65) v1(1.64,9.22) v1(5.44,46.08) v1(5.44,35.92) v1(5.44,30.84) v1(5.44,5.44) v1(7.48,2.74) v1(10.52,46.08) v1(10.52,41) v1(10.52,35.92) v1(10.52,25.76) v1(10.52,15.6) v1(10.52,10.52) v1(14.84,10.65) v1(15.6,46.08) v1(15.6,41) v1(15.6,35.92) v1(15.6,30.84) v1(15.6,20.68) v1(15.6,15.6) v1(20.68,46.08) v1(20.68,35.92) v1(20.68,15.6) v1(25.76,46.08) v1(25.76,41) v1(25.76,35.92) v1(30.84,46.08) v1(30.84,10.52) v1(35.55,29.79) v1(35.92,46.08) v1(35.92,35.92) v1(38.21,30.3) v1(39.99,29.67) v1(41,46.08) v1(41,41) v1(41,35.92) v1(41,5.44) v1(46.08,46.08) v1(46.08,35.92) v1(46.08,30.84) v1(46.08,25.76) v1(46.08,15.6) v1(46.08,10.52) v1(51.16,46.08) v1(51.16,41) v1(51.16,35.92) v1(51.16,30.84) v1(51.16,20.68) v1(51.16,15.6) v1(51.16,10.52) v1(51.16,5.44)
PGND: length 66.1
  Top Layer w0.254: v1(37.96,20.02) 39.23,20.02 39.6,19.65 U1.6
  Top Layer w0.762: J2.6 J2.5 ; Q8.2 22.18,24.94 21.82,24.57 Q7.3
  Bottom Layer w0.254: 29.83,19.63 32.25,19.63 32.62,19.26 37.21,19.26 v1(37.96,20.02)
  Bottom Layer w0.762: J2.5 24.75,1.09 24.34,0.68 18.05,0.68 17.39,1.35 17.39,8.59 18.66,9.86 28.31,9.86 29.83,11.38 29.83,22.05 26.91,24.97 v1(22.21,24.97)
VCC: length 57.2
  Top Layer w0.254: C2.2 38.52,16.28 38.1,16.71 U1.3
  Top Layer w0.762: U2.8 29.83,29.92 31.48,28.27 37.83,28.27 J1.4 ; U2.8 28.27,24.98 29.96,23.29 ; U2.8 26.08,29.92 C3.2 21.95,29.98 21.23,29.27 Q8.3 21.18,28.21 C10.2 17.8,28.43 U5.2 ; OSC1.4 32.4,15.48 C1.1 32.36,15.44 v1(31.36,15.44) 29.96,16.84 29.96,23.29 ; v1(37.76,15.32) 38.52,15.32 C2.2 ; 29.96,23.29 R1.1
  Bottom Layer w0.762: v1(31.36,15.44) 31.48,15.32 v1(37.76,15.32)
VDD: length 68.2
  Top Layer w0.254: v1(44.64,18.36) 44.64,19.42 R4.1
  Top Layer w0.508: D3.2 3.76,9.89 4.94,8.71 14.21,8.71 16.12,6.81 16.12,4.52 17.13,3.51 20.94,3.51 J2.3
  Top Layer w0.762: R11.1 3.78,16.13 D3.2
  Bottom Layer w0.254: v1(44.64,18.36) 44.64,8.79 42.15,6.3 34.4,6.3 33.77,5.66 33.77,4.27 32.88,3.38 23.36,3.38 J2.3
VDD_ADC: length 2.5
  Top Layer w0.254: 40.52,19.52 40.53,19.51 R4.2
VDD_UP: length 30.7
  Top Layer w0.254: R8.2 33.02,9.42 v1(33.52,9.42) ; 40.1,18.08 40.1,17.25 v1(41.26,16.08)
  Top Layer w0.762: R2.2 R3.2 27.21,8.83 R6.2 29.78,8.78 R7.2 32.32,8.83 R8.2
  Bottom Layer w0.254: v1(33.52,9.42) 40.58,9.42 41.26,10.11 v1(41.26,16.08)
485_A: length 8.4
  Top Layer w0.254: DSUB1.1 29.96,37.84 29.96,32.84 29.58,32.46 U2.6
485_B: length 10.2
  Top Layer w0.254: DSUB1.2 30.59,37.87 30.59,31.7 30.09,31.19 U2.7
I2C_SCL: length 38.1
  Top Layer w0.254: 40.52,20.52 41.51,20.52 42.03,21.03 v1(42.53,21.03)
  Top Layer w0.508: R6.1 27.29,7.24 J2.8 J2.7
  Bottom Layer w0.254: J2.8 27.29,6.93 28.18,7.82 41.52,7.82 43.07,9.37 43.07,20.5 42.53,21.03
I2C_SDA: length 37.1
  Top Layer w0.254: 40.52,21.02 41.37,21.02 42.02,21.67 v1(43.04,21.67)
  Top Layer w0.508: R7.1 J2.10 J2.9
  Bottom Layer w0.254: v1(43.04,21.67) 43.55,21.16 43.55,9.22 41.64,7.32 30.72,7.32 29.83,6.43 J2.10
M1(2)_EN: length 58.1
  Top Layer w0.254: R13.1 5.91,23.24 v1(6.34,22.81) ; v1(43.17,27.51) 43.17,25.22 41.44,23.5 40.05,23.5 39.6,23.05 U1.16
  Top Layer w0.762: R13.1 5.3,21.72 R12.1
  Bottom Layer w0.254: v1(43.17,27.51) 43.17,30.9 40.21,33.86 30.85,33.86 27.42,30.43 27.42,27.89 26.53,27 20.43,27 19.67,26.24 15.86,26.24 13.14,23.52 7.05,23.52 v1(6.34,22.81)
OS_EN: length 40.8
  Top Layer w0.254: v1(18.91,25.02) 18.71,24.82 R22.1 ; v1(41.9,27.51) 41.9,25.48 40.88,24.46 39.36,24.46 38.1,23.2 U1.19
  Bottom Layer w0.254: v1(41.9,27.51) 41.9,30.68 39.74,32.84 31.36,32.84 28.44,29.92 28.44,27.25 27.17,25.98 20.94,25.98 19.98,25.02 v1(18.91,25.02)
OWI: length 36.1
  Top Layer w0.254: U1.14 41.11,21.52 41.85,22.25 43.28,22.25 v1(43.83,21.7)
  Top Layer w0.508: R8.1 32.37,7.27 J2.12 J2.11
  Bottom Layer w0.254: v1(43.83,21.7) 44.06,21.48 44.06,8.97 41.9,6.81 32.88,6.81 32.37,6.3 J2.12
PWR: length 54.9
  Top Layer w0.254: v1(7.91,22.94) 7.23,22.94 6.76,23.4 U3.3 ; U1.17 39.1,23.31 39.74,23.95 41.14,23.95 42.53,25.35 42.53,26.75 42.41,26.87
  Bottom Layer w0.254: v1(7.91,22.94) 13.45,22.94 16.24,25.73 19.93,25.73 20.69,26.49 26.91,26.49 27.93,27.51 27.93,30.18 31.1,33.35 39.99,33.35 42.48,30.86 v1(42.48,26.87)
SWD_CLK: length 5.5
  Top Layer w0.254: J1.2 35.67,25.35 35.67,24.46 37.1,23.04 U1.21
SWD_IO: length 5.4
  Top Layer w0.254: U1.20 37.6,23.3 36.18,24.71 36.18,25.35 J1.3
UART_DE: length 24.7
  Top Layer w0.254: v1(32.88,21.03) 32.9,21.02 U1.23 ; v1(31.55,31) 31.74,31.19 U2.2 36.06,31.19 36.43,31.56 R9.1 U2.3
  Bottom Layer w0.254: v1(32.88,21.03) 29.58,24.33 29.58,29.03 v1(31.55,31)
UART_RX: length 17.5
  Top Layer w0.254: U2.1 33.67,29.91 v1(31.28,29.91) ; U1.27 34.98,19.02 v1(34.15,19.85)
  Bottom Layer w0.254: v1(34.15,19.85) 34.15,20.59 30.09,24.65 30.09,28.71 v1(31.28,29.91)
UART_TX: length 22.4
  Top Layer w0.254: U2.4 31.48,33.73 31.23,33.48 31.23,31.51 v1(30.75,31.03) ; U1.26 35.31,19.52 34.39,20.43 v1(33.44,20.43)
  Bottom Layer w0.254: v1(33.44,20.43) 32.65,20.43 29.07,24.02 29.07,29.35 v1(30.75,31.03)
USART_RX: length 36.9
  Top Layer w0.254: v1(42.48,16.59) 42.48,17.97 41.44,19.02 40.52,19.02
  Top Layer w0.762: J2.4 R3.1
  Bottom Layer w0.254: J2.4 22.21,7.06 23.48,8.33 41.26,8.33 42.48,9.55 v1(42.48,16.59)
USART_TX: length 38.1
  Top Layer w0.254: U1.8 41.11,18.52 v1(41.9,17.73)
  Top Layer w0.762: R2.1 J2.2
  Bottom Layer w0.254: v1(41.9,17.73) 41.9,9.73 41.01,8.84 21.2,8.84 19.67,7.32 J2.2
VPP: length 48
  Top Layer w0.762: Q1.3 J2.1 19.67,1.25 20.21,0.71 43.93,0.71 45.45,2.24 45.45,8.59 44.18,9.86 40.88,9.86 40.05,10.68 Q2.2 38.84,10.68 ; R16.2 38.72,10.56 38.84,10.68 ; Q3.2 38.84,10.68
VPP_ADC: length 17.1
  Top Layer w0.254: R5.1 42.8,14.06 45.83,17.09 45.83,20.27 45.65,20.45 42.2,20.45 41.77,20.02 40.52,20.02
  Top Layer w0.762: Q2.3 R5.1
VPP_EN: length 79.6
  Top Layer w0.254: R20.2 10.22,6.55 v1(9.28,6.55) ; v1(43.75,26.87) 43.75,25.04 41.77,23.06 40.5,23.06 40.1,22.66 U1.15
  Top Layer w0.762: Q4.1 11.56,6.48 R20.2
  Bottom Layer w0.254: v1(9.28,6.55) 6.85,6.55 5.32,8.08 5.32,23.02 6.38,24.08 12.94,24.08 15.61,26.75 19.42,26.75 20.18,27.51 26.15,27.51 26.91,28.27 26.91,30.68 30.59,34.37 40.5,34.37 43.75,31.12 v1(43.75,26.87)
$1N1691: length 3.2
  Top Layer w0.762: U3.4 6.76,20.38 6.95,20.2 ; 6.95,20.2 R12.2 ; 6.95,20.2 R10.1
$1N1692: length 5.7
  Top Layer w0.762: D3.1 8.41,16.17 C5.2 8.47,18.58 R10.2 8.66,20.38 U3.5
$1N3646: length 1.8
  Top Layer w0.762: 15.3,19.59 16.33,19.59 U4.4
$1N3648: length 3.3
  Top Layer w0.762: R14.1 19.55,19.06 U4.3 21.21,19.03 R19.2
$1N3649: length 6.2
  Top Layer w0.762: U4.1 19.58,14.35 L1.2 22.51,13.52 D4.1
$1N3650: length 48.6
  Top Layer w0.762: C6.2 v1(28.54,16.57) 28.56,16.59 28.56,20.65 27.8,21.41 23.23,21.41 22.47,20.65 R14.2 ; C6.2 27.26,16.38 D4.2 ; C6.2 27.03,16.6 C7.2 ; R15.2 13.56,1.55 Q1.2 15.17,1.29 v1(15.23,1.35)
  Bottom Layer w0.762: v1(28.54,16.57) 28.54,12.25 27.42,11.13 18.02,11.13 15.99,9.09 15.99,2.11 v1(15.23,1.35)
$1N6475: length 5.2
  Top Layer w0.254: R22.2 20.1,22.72 Q7.1 20.28,22.61 Q8.1
$1N6524: length 4.4
  Top Layer w0.762: R15.1 13.69,3.06 Q1.1 13.81,3.19 Q4.3
$1N8025: length 3.1
  Top Layer w0.762: DC1.1 8.82,35.45 D1.1
$1N8260: length 2.9
  Top Layer w0.254: OSC1.3 36.52,16.42 37.1,16.99 U1.1
$1N9279: length 8.4
  Top Layer w0.762: 35.03,7.32 Q3.3 35.03,11.37 36.24,12.58 Q2.1
$1N9281: length 5.6
  Top Layer w0.762: D5.1 42.72,7.71 R16.1 38.72,6.18 R18.2
$1N9282: length 2.7
  Top Layer w0.762: R18.1 37.21,8.65 Q3.1
$1N12699: length 4.9
  Top Layer w0.254: LED1.1 31.96,18.52 U1.28
$1N12700: length 1.7
  Top Layer w0.254: R1.2 LED1.2

## Copper pours and planes (outline as drawn; the poured copper is in the pictures)
GND on Top Layer: -6.62,51.64 58.41,51.64 58.41,-2.97 -6.62,-2.97
GND on Bottom Layer: -4.71,52.15 57.01,52.15 57.01,-6.65 -4.71,-6.65

## Text on the board
Bottom Silkscreen Layer: TX | VPP | RX | VDD | GND | SCL | SDA | OWI
Top Silkscreen Layer: G | CLK | IO | V+ | 16005 WF280_OS_V1_20260323
